# Altium schematic sheet GESTUREDCONTROLCAR.SchDoc
size A4; SheetNumber: 1; SheetTotal: 1
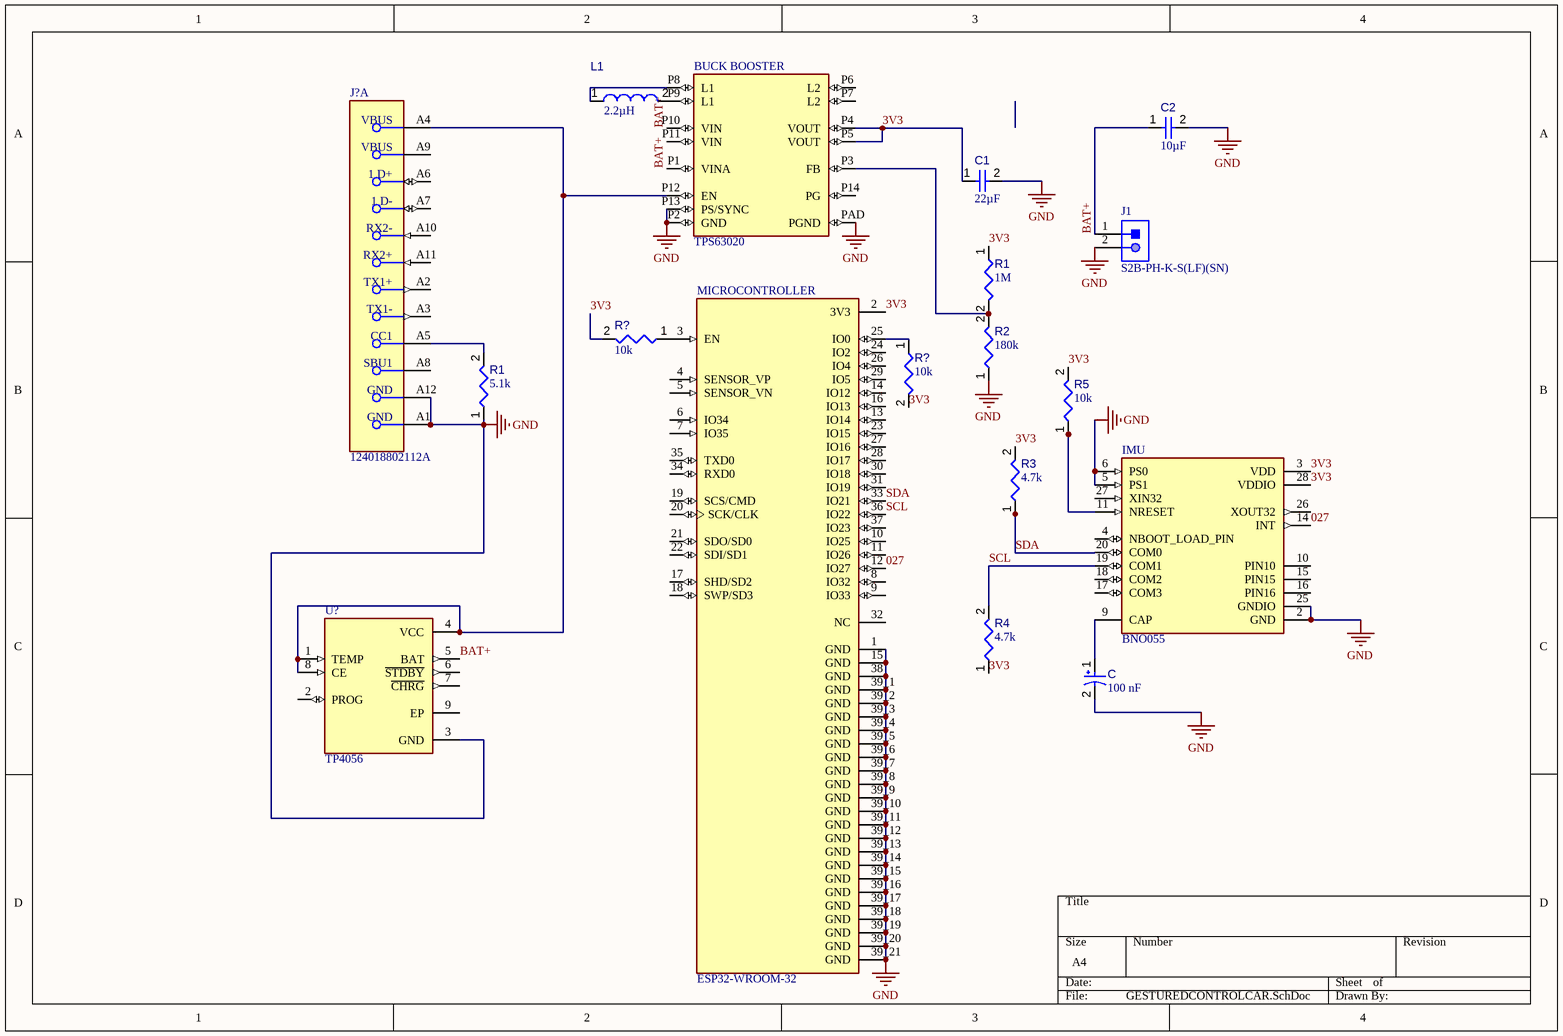
[diagram p0: GESTUREDCONTROLCAR.SchDoc]

## Parts
(Parts that share a designator on the sheet are numbered #1, #2 ... from top to bottom, then left to right.)
BUCK_BOOSTER  TPS63020  [QFN14+1]
C  value 100 nF  [CAPPR55-250-1120X630X1220]  (hidden comment: ECA1HM470)
C1  value 22µF  [CAPC0402(1005)60_L]  (hidden comment: Capacitor 100nF +/-20% 50V 0402)
C2  value 10µF  [CAPC0402(1005)60_L]  (hidden comment: Capacitor 100nF +/-20% 50V 0402)
IMU  BNO055  [LGA28R50P4X10_380X520X100]
J1  S2B-PH-K-S(LF)(SN)  [JST-S2B-PH-K-S_V]
J?  124018802112A  [FP-124018802112A-MFG]  (part A of 3)
L1  value 2.2µH  [INDR62-500-1100X850X1100]  (hidden comment: RL622-101K-RC)
MICROCONTROLLER  ESP32-WROOM-32  [MODULE_ESP32-WROOM-32]
R1#1  value 1M  [RESC0402(1005)_L]  (hidden comment: 8D2R2J)
R1#2  value 5.1k  [RESC1608X55X25ML10T15]  (hidden comment: Resistor 5.1k)
R2  value 180k  [RESC0402(1005)_L]  (hidden comment: 8D2R2J)
R3  value 4.7k  [RESC0402(1005)_L]  (hidden comment: 8D2R2J)
R4  value 4.7k  [RESC0402(1005)_L]  (hidden comment: 8D2R2J)
R5  value 10k  [RESC0402(1005)_L]  (hidden comment: 8D2R2J)
R?#1  value 10k  [RESC0402(1005)_L]  (hidden comment: 1KR2J)
R?#2  value 10k  [RESC0402(1005)_L]  (hidden comment: 1KR2J)
U?  TP4056  [SOP127P600X175-9N]

## Nets
GND: BUCK_BOOSTER.P2(GND) BUCK_BOOSTER.P13(PS/SYNC) BUCK_BOOSTER.PAD(PGND) C.2 C1.2 C2.2 IMU.2(GND) IMU.5(PS1) IMU.6(PS0) IMU.25(GNDIO) J1.2 J?.A1(GND) J?.A12(GND) MICROCONTROLLER.1(GND) MICROCONTROLLER.15(GND) MICROCONTROLLER.38(GND) MICROCONTROLLER.39_1(GND) MICROCONTROLLER.39_2(GND) MICROCONTROLLER.39_3(GND) MICROCONTROLLER.39_4(GND) MICROCONTROLLER.39_5(GND) MICROCONTROLLER.39_6(GND) MICROCONTROLLER.39_7(GND) MICROCONTROLLER.39_8(GND) MICROCONTROLLER.39_9(GND) MICROCONTROLLER.39_10(GND) MICROCONTROLLER.39_11(GND) MICROCONTROLLER.39_12(GND) MICROCONTROLLER.39_13(GND) MICROCONTROLLER.39_14(GND) MICROCONTROLLER.39_15(GND) MICROCONTROLLER.39_16(GND) MICROCONTROLLER.39_17(GND) MICROCONTROLLER.39_18(GND) MICROCONTROLLER.39_19(GND) MICROCONTROLLER.39_20(GND) MICROCONTROLLER.39_21(GND) R1#2.1 R2.1 U?.3(GND)
3V3: BUCK_BOOSTER.P4(VOUT) BUCK_BOOSTER.P5(VOUT) C1.1 IMU.3(VDD) IMU.28(VDDIO) MICROCONTROLLER.2(3V3) R1#1.1 R3.2 R4.1 R5.2 R?#1.2 R?#2.2
027: IMU.14(INT) MICROCONTROLLER.12(IO27)
BAT+: BUCK_BOOSTER.P1(VINA) BUCK_BOOSTER.P10(VIN) C2.1 J1.1 U?.5(BAT)
SCL: IMU.19(COM1) MICROCONTROLLER.36(IO22) R4.2
SDA: IMU.20(COM0) MICROCONTROLLER.33(IO21) R3.1
NetBUCK_BOOSTER_P3: BUCK_BOOSTER.P3(FB) R1#1.2 R2.2
NetBUCK_BOOSTER_P8: BUCK_BOOSTER.P8(L1) L1.1
NetBUCK_BOOSTER_P12: BUCK_BOOSTER.P12(EN) J?.A4(VBUS) U?.1(TEMP) U?.4(VCC) U?.8(CE)
NetC_1: C.1 IMU.9(CAP)
NetIMU_11: IMU.11(NRESET) R5.1
NetJ?_A5: J?.A5(CC1) R1#2.2
NetMICROCONTROLLER_3: MICROCONTROLLER.3(EN) R?#1.1
NetMICROCONTROLLER_25: MICROCONTROLLER.25(IO0) R?#2.1

Not connected (* = marked no-connect by the designer): BUCK_BOOSTER P6(L2) P7(L2) P9(L1) P11(VIN) P14(PG); IMU 4(NBOOT_LOAD_PIN) 10(PIN10) 15(PIN15) 16(PIN16) 17(COM3) 18(COM2) 26(XOUT32) 27(XIN32); J? A2(TX1+) A3(TX1-) A6(1_D+) A7(1_D-) A8(SBU1) A9(VBUS) A10(RX2-) A11(RX2+); L1 2; MICROCONTROLLER 4(SENSOR_VP) 5(SENSOR_VN) 6(IO34) 7(IO35) 8(IO32) 9(IO33) 10(IO25) 11(IO26) 13(IO14) 14(IO12) 16(IO13) 17(SHD/SD2) 18(SWP/SD3) 19(SCS/CMD) 20(SCK/CLK) 21(SDO/SD0) 22(SDI/SD1) 23(IO15) 24(IO2) 26(IO4) 27(IO16) 28(IO17) 29(IO5) 30(IO18) 31(IO19) 32(NC) 34(RXD0) 35(TXD0) 37(IO23); U? 2(PROG) 6(~{STDBY}) 7(~{CHRG}) 9(EP)

## Library data of the parts
BUCK_BOOSTER = CMP-031-00006-1: Buck-Boost Switching Regulator IC Positive Adjustable 1.2V 1 Output 3.5A (Switch) 14-VFDFN Exposed Pad; MF: Texas Instruments; Component Type: Standard; Purchase-URL: https://pricing.snapeda.com/search/part/TPS63020/?ref=eda; Case/Package: None; Source: TPS63020.SchLib; Check_prices: https://www.snapeda.com/parts/TPS63020/Texas+Instruments/view-part/?ref=eda; Pins: 15; Design Item ID: TPS63020; MP: TPS63020; Price: None; Value: *; SnapEDA_Link: https://www.snapeda.com/parts/TPS63020/Texas+Instruments/view-part/?ref=snap; Availability: In Stock
C = CMP-001-00030-7: Aluminum Electrolytic Capacitor, 47 uF, +/- 20%, 50 V, -40 to 85 degC, 2-Pin THD, RoHS, Bulk; Manufacturer: Panasonic; Voltage Rating: 50V; Ripple Current: 130mA; Package Reference: CAPPR55-250-1120X630X1220; Packaging: Bulk; Case/Package: Radial; Pins: 2; Package Description: 2-Pin Radial Lead, Dia 6.3 mm, Height 12.2 mm; Capacitor Type: Electrolytic; Max Operating Temperature: 85°C; Min Operating Temperature: -40°C; Datasheet Version: Rev. 05, 10/2016; Manufacturer URL: http://www.panasonic.com/; RoHS Compliant: True; Lead Pitch: 2.5mm; Package Quantity: 200; Mounting Technology: TH; Ripple Current (AC): 130mA; Datasheet URL: https://industrial.panasonic.com/cdbs/www-data/pdf/RDF0000/ABA0000C1218.pdf; Tolerance: 20%; Diameter: 6.3mm
C1 C2 = CMP-001-00067-3: Chip Capacitor, 100nF +/-20%, 50V, 0402, Thickness 0.6 mm; Tolerance: 10%; Min Operating Temperature: -55°C; Pins: 2; Case/Package: 0402; Max Operating Temperature: 85°C; Voltage Rating: 50V; Mounting Technology: SMT
IMU = CMP-007-000000-1: BNO055 9-axis Absolute Orientation Sensor ( SiP ) w/Sensors and Sensor Fusion; Component Type: Standard; Package: None; Price: None; MP: BNO055; Design Item ID: BNO055; Value: *; Pin Count: 19; Source: BNO055.SchLib; Availability: Unavailable
J1 = CMP-002-00030-2: Male Header, Pitch 2 mm, 1 x 2 Position, Height 4.8 mm, Tail Length 3.4 mm, -25 to 85 degC, RoHS, Bulk; Manufacturer: Japan Solderless Terminals; Package Reference: S2B-PH-K-S; Case/Package: S2B-PH-K-S; Datasheet URL: http://www.jst-mfg.com/product/pdf/eng/ePH.pdf; RoHS Compliant: Unknown; Datasheet Version: Dec-12; Gender: Male; Min Operating Temperature: -25°C; Max Operating Temperature: 85°C; Package Description: Male Header, Pitch 2 mm, 1 x 2 Position, Height 4.8 mm, Tail Length 3.4 mm; Connector Type: Header; Mounting Technology: SM
J? = CMP-02355-000005-1: USB TYPE C, RECEPTACLE, TOP MOUN
L1 = CMP-006-00013-6: Radial Inductor, 100 uH, +/- 10%, 0.91 A, -55 to 105 degC, 2-Pin THD, RoHS, Bulk; Manufacturer: Bourns; Q Factor: 20; Shielding: Unshielded; Core Material: Ferrite; Self Resonant Frequency: 3.7MHz; Resistance: 0.28Ohm; Current Rating: 910mA; Datasheet URL: http://www.bourns.com/docs/Product-Datasheets/rl622_series.pdf; Pins: 2; Inductance Tolerance: 10%; Packaging: Bulk; Tolerance: 10%; Diameter: 8.5mm; RoHS Compliant: True; Max Operating Temperature: 105°C; Package Quantity: 100; Package Reference: INDR62-500-1100X850X1100; Mounting Technology: TH; Lead Pitch: 5mm; Datasheet Version: Aug-10; Min Operating Temperature: -55°C; Package Description: 2-Pin Radial Lead, Dia 8.5 mm, Pitch 5 mm; Case/Package: Radial
MICROCONTROLLER = CMP-011-000000-1: Bluetooth, WiFi 802.11b/g/n, Bluetooth v4.2 +EDR, Class 1, 2 and 3 Transceiver Module 2.4GHz ~ 2.5GHz Antenna Not Included, U.FL Surface Mount; MF: Espressif Systems; MP: ESP32-WROOM-32; SnapEDA_Link: https://www.snapeda.com/parts/ESP32-WROOM-32/Espressif+Systems/view-part/?ref=snap; Source: ESP32-WROOM-32.SchLib; Price: None; Design Item ID: ESP32-WROOM-32; Component Type: Standard; Value: *; Check_prices: https://www.snapeda.com/parts/ESP32-WROOM-32/Espressif+Systems/view-part/?ref=eda; Purchase-URL: https://pricing.snapeda.com/search/part/ESP32-WROOM-32/?ref=eda; Availability: In Stock; Package: Module Espressif Systems; Pin Count: 59
R1#1 R2-R5 = CMP-009-00112-2: 8R2 0.063W 5% 0402 (1005 Metric)  SMD; Power: 63mW; Pins: 2; Mounting Technology: SMT; Tolerance: 5%; Case/Package: 0402
R1#2 = CMP-009-00017-5: Chip Resistor, 5.1 KOhm, +/- 1%, 01 W, -55 to 155 degC, 0603 (1608 Metric); Voltage Rating: 50V; Power: 100mW; RoHS Compliant: True; Min Operating Temperature: -55°C; Pins: 2; Case/Package: 0603; Mounting Technology: SM; Max Operating Temperature: 155°C; Tolerance: 1%
R?#1 R?#2 = CMP-009-00075-2: 1K 0.063W 5% 0402 (1005 Metric)  SMD; Power: 63mW; Pins: 2; Mounting Technology: SMT; Case/Package: 0402; Tolerance: 5%
U? = CMP-00029-00001-1: Complete single cell Li-Ion battery with a constant current / constant voltage linear charger; MF: NanJing Top Power ASIC Corp.; Pins: 9; MP: TP4056; Price: None; Check_prices: https://www.snapeda.com/parts/TP4056/NanJing+Top+Power+ASIC+Corp./view-part/?ref=eda; Value: *; SnapEDA_Link: https://www.snapeda.com/parts/TP4056/NanJing+Top+Power+ASIC+Corp./view-part/?ref=snap; Case/Package: Package; Source: TP4056.SchLib; Component Type: Standard; Design Item ID: TP4056; Availability: Not in stock